# EasyEDA Pro project Rear_ESP32S3_R26.epro, schematic Rear_Mainboard_ESP32S3_V0.3, sheets 1 to 2 of 5

## Sheets
1 01_USB_Power: Assembly Variant: Basic; Board Name: Board1; Create Date: 2026-10-07; Page Name: P1; Project Name: 多模态手写笔_后部主板_V0.1; Schematic Name: Schematic1; Update Date: 2026-10-07; Add into BOM: yes; Company: 嘉立创EDA; Convert to PCB: yes; Page Size: A3; Version: V0.1
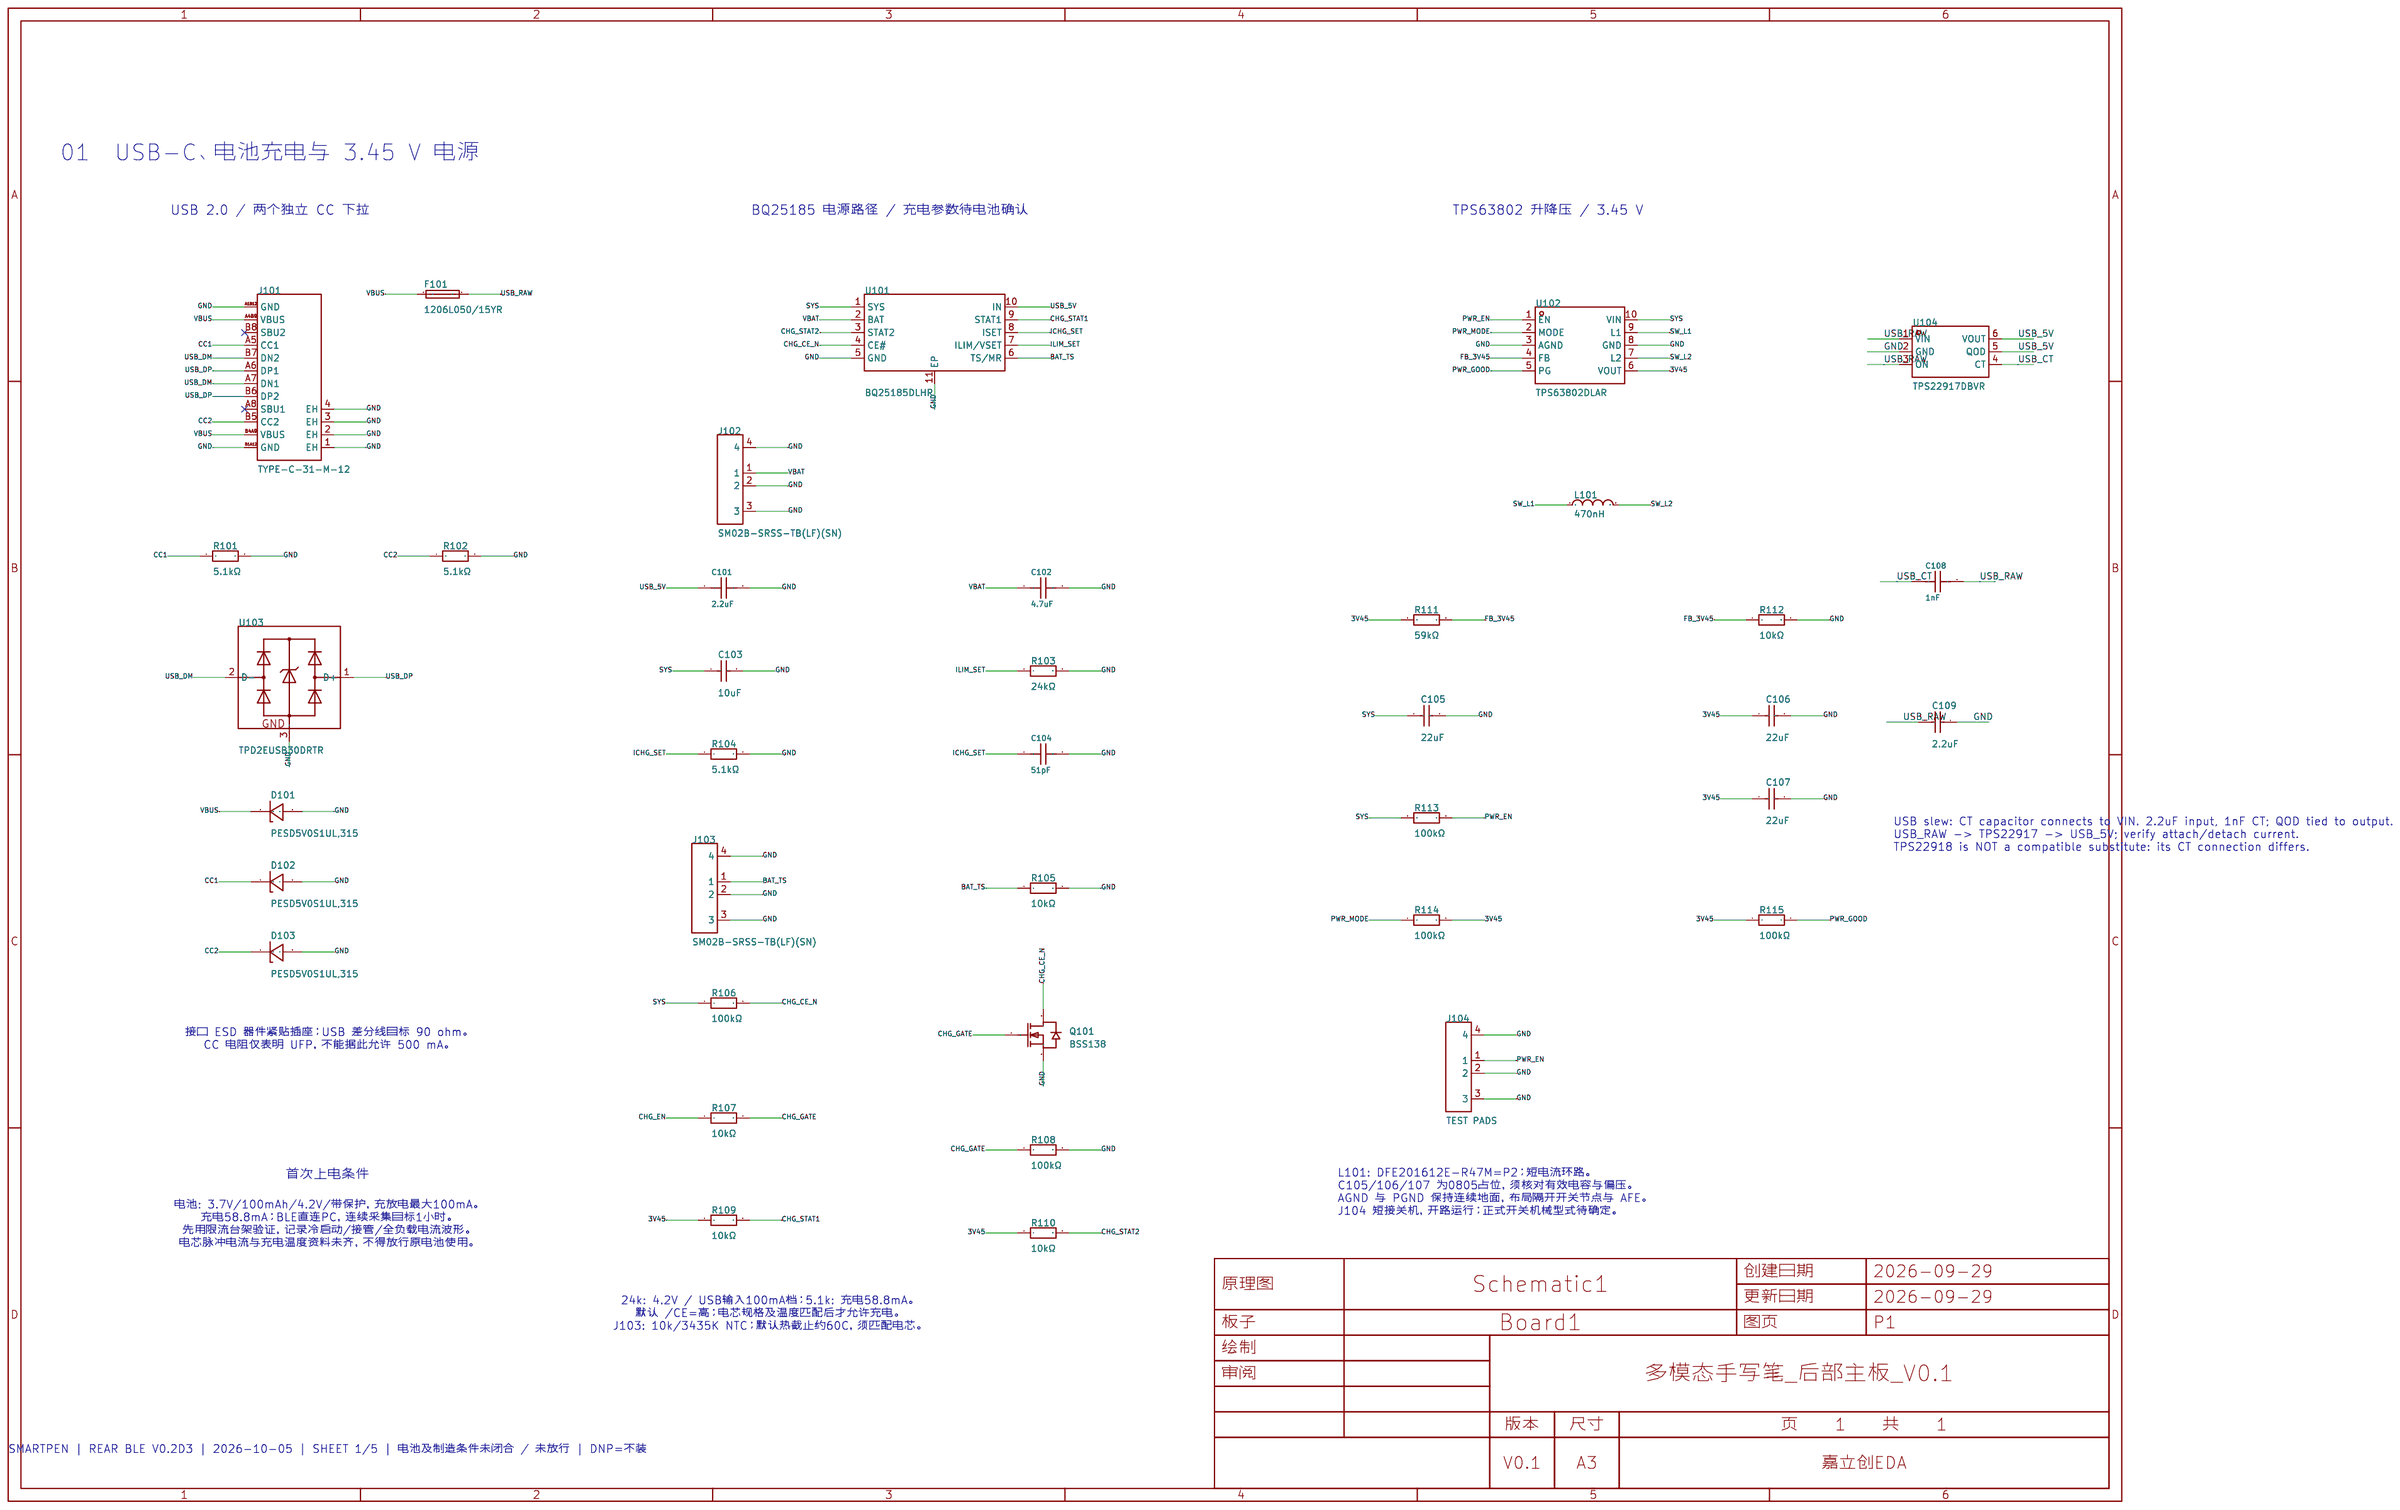
[diagram p0: 01_USB_Power]
2 02_ESP32S3_BLE_USB
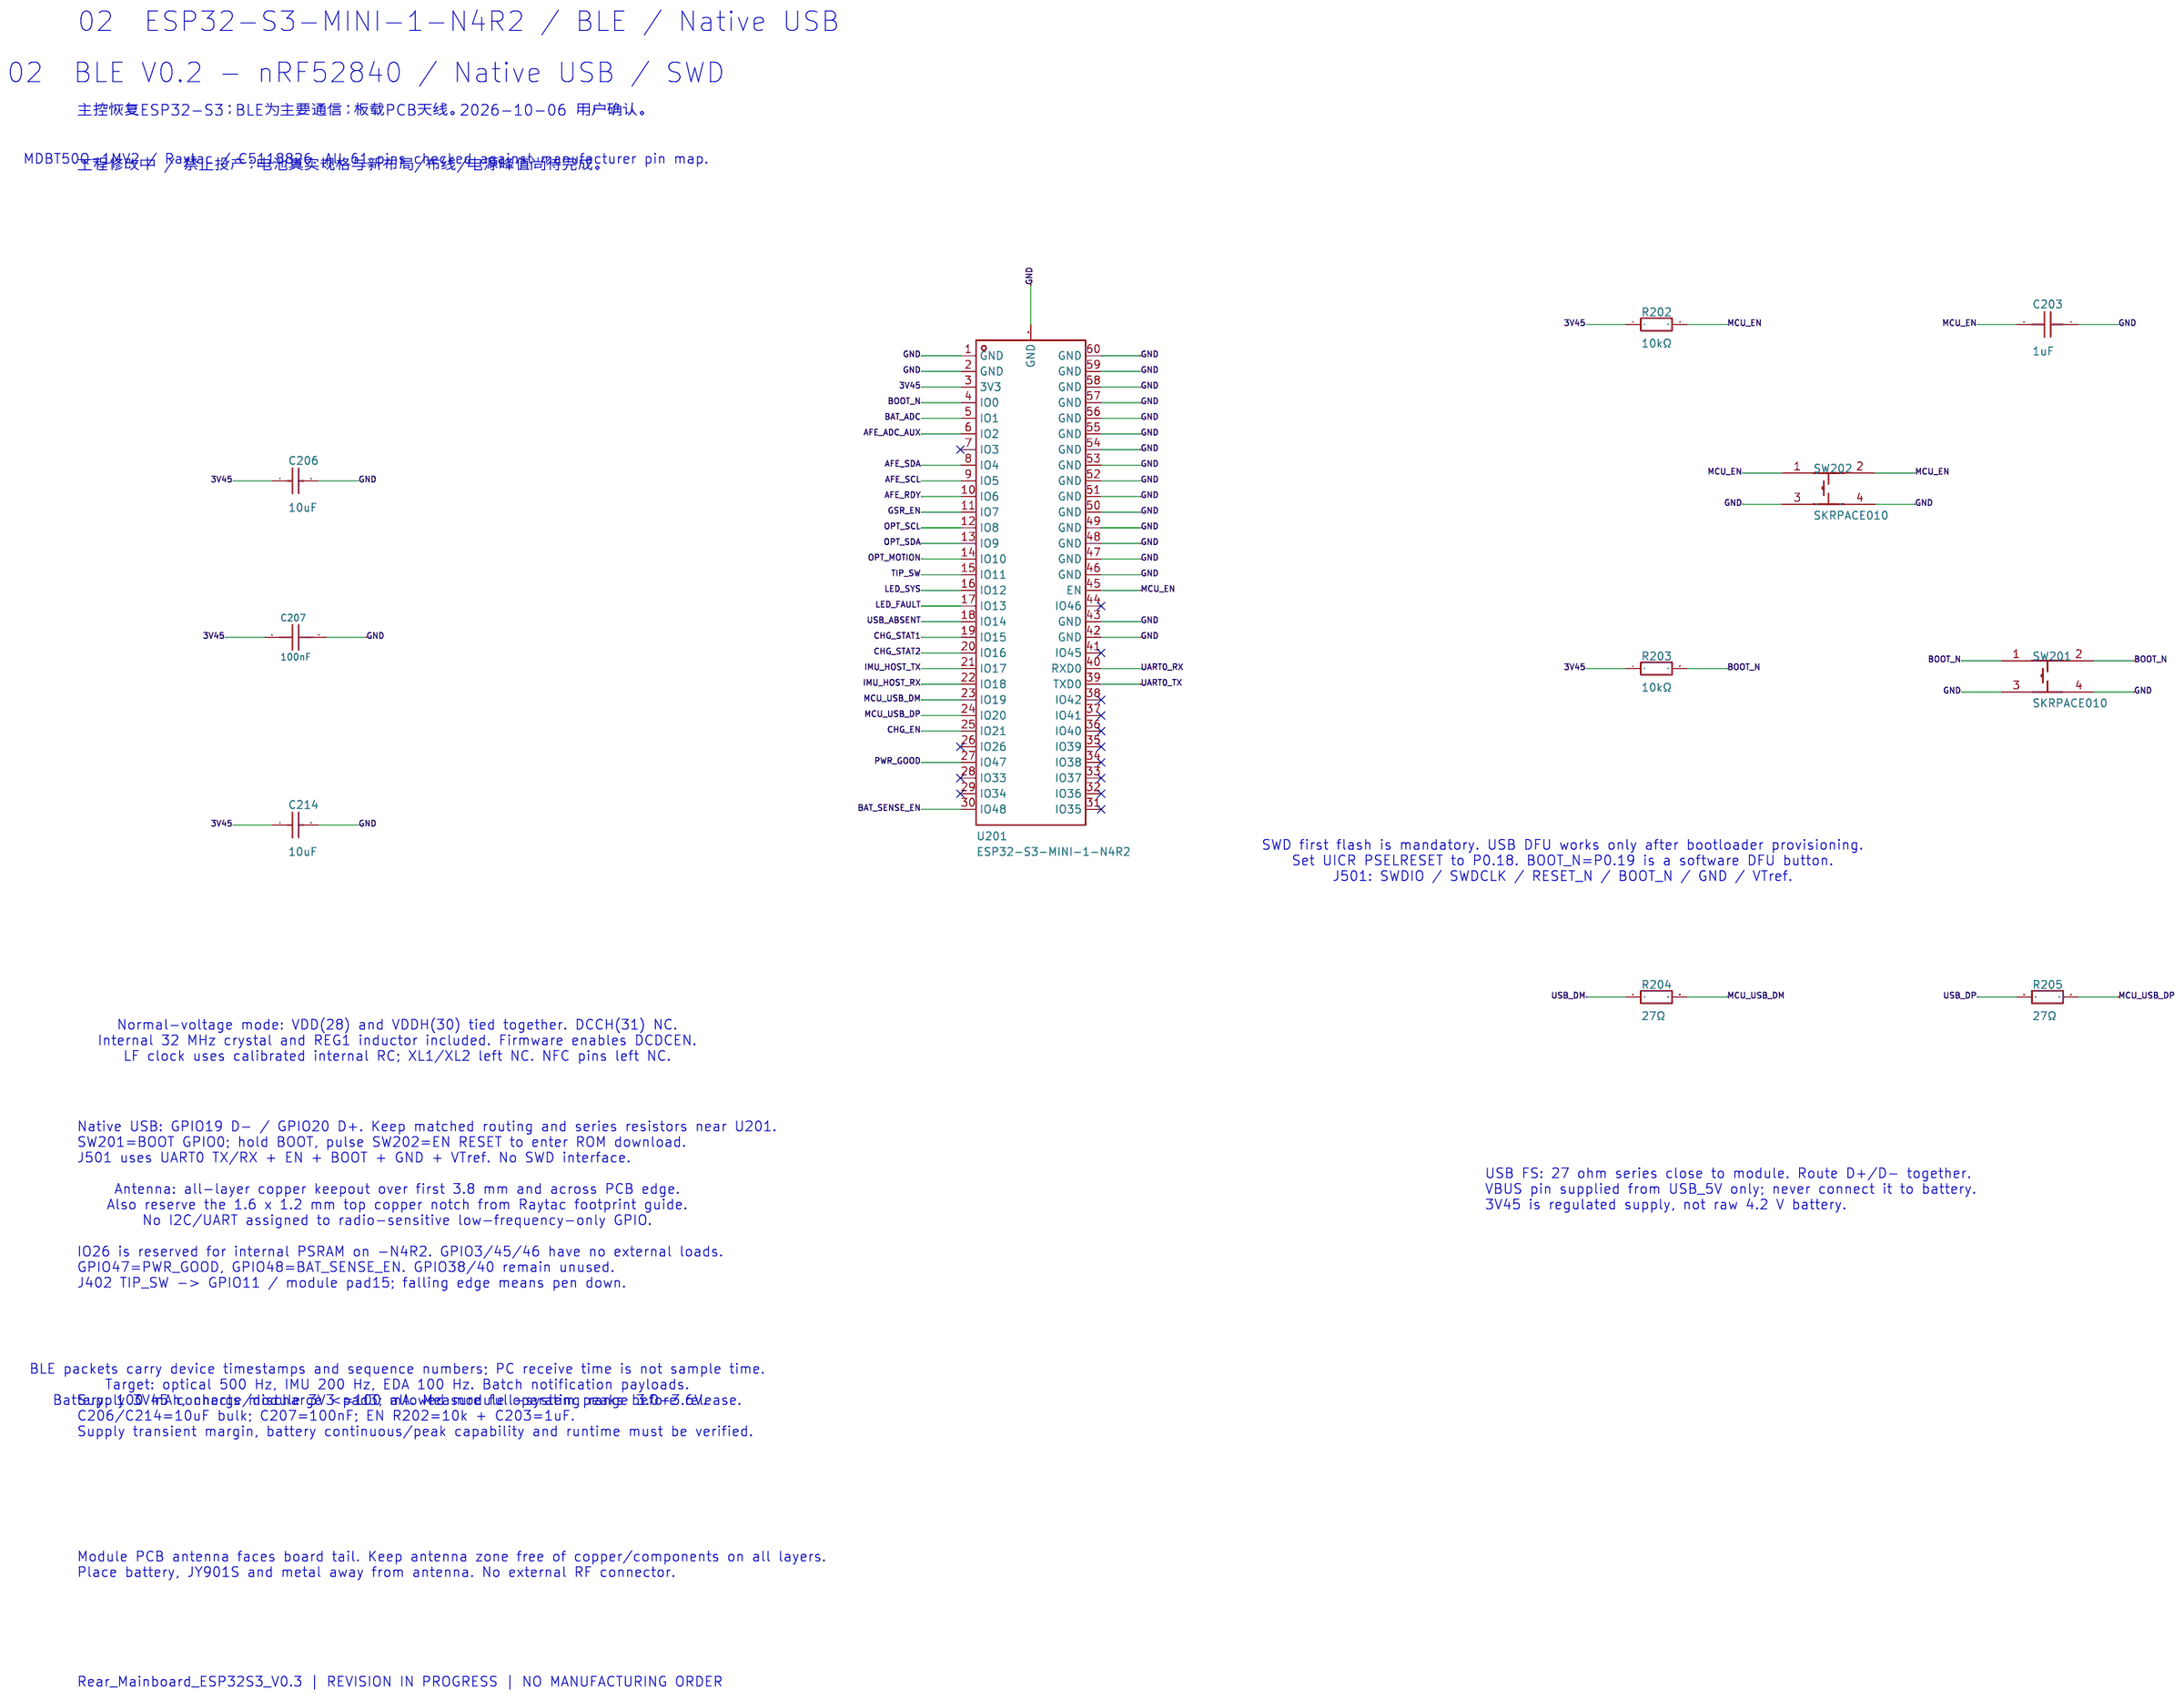
[diagram p1: 02_ESP32S3_BLE_USB]

## Parts
sheet 01_USB_Power
C101  2.2uF  [C0603]
C102  4.7uF  [C0603]
C103  10uF  [C0805]
C104  51pF  [C0603]  (no BOM)
C105  22uF  [C0805]
C106  22uF  [C0805]
C107  22uF  [C0805]
C108  1nF  [C0603]
C109  2.2uF  [C0603]
D101  PESD5V0S1UL,315  [SOD-882_L1.0-W0.6-RD]
D102  PESD5V0S1UL,315  [SOD-882_L1.0-W0.6-RD]
D103  PESD5V0S1UL,315  [SOD-882_L1.0-W0.6-RD]
F101  1206L050/15YR  [F1206]
J101  TYPE-C-31-M-12  [USB-C_SMD-TYPE-C-31-M-12_1]
J102  SM02B-SRSS-TB(LF)(SN)  [CONN-SMD_2P-P1.00_SM02B-SRSS-TB-LF-SN]
J103  SM02B-SRSS-TB(LF)(SN)  [CONN-SMD_2P-P1.00_SM02B-SRSS-TB-LF-SN]
J104  TEST PADS  [SMARTPEN_J104_TEST_4P_P1.27]  (no BOM)
L101  470nH  [IND-SMD_L2.0-W1.6-1]
Q101  BSS138  [SOT-23-3_L3.0-W1.7-P0.95-LS2.9-BR]
R101  5.1kΩ  [R0603]
R102  5.1kΩ  [R0603]
R103  24kΩ  [R0603]
R104  5.1kΩ  [R0603]
R105  10kΩ  [R0603]  (no BOM)
R106  100kΩ  [R0603]
R107  10kΩ  [R0603]
R108  100kΩ  [R0603]
R109  10kΩ  [R0603]
R110  10kΩ  [R0603]
R111  59kΩ  [R0603]
R112  10kΩ  [R0603]
R113  100kΩ  [R0603]
R114  100kΩ  [R0603]
R115  100kΩ  [R0603]
U101  BQ25185DLHR  [WSON-10_L2.2-W2.0-P0.40-BL-EP_TI_DLH0010A]
U102  TPS63802DLAR  [VSON-10_L3.0-W2.0-P0.50-TL]
U103  TPD2EUSB30DRTR  [SOT-9X3-3_L1.0-W0.8-P0.35-LS1.0-BR]
U104  TPS22917DBVR  [SOT-23-6_L2.9-W1.6-P0.95-LS2.8-BR]
sheet 02_ESP32S3_BLE_USB
C203  1uF  [C0603]
C206  10uF  [C0805]
C207  100nF  [C0603]
C214  10uF  [C0805]
R202  10kΩ  [R0603]
R203  10kΩ  [R0603]
R204  27Ω  [R0603]
R205  27Ω  [R0603]
SW201  SKRPACE010  [KEY-SMD_4P-L4.2-W3.2-P2.20-LS4.6]
SW202  SKRPACE010  [KEY-SMD_4P-L4.2-W3.2-P2.20-LS4.6]
U201  ESP32-S3-MINI-1-N4R2  [BULETM-SMD_ESP32-S3-MINI-1-N8]

## Library data of the parts
C101 C109 = CL10A225KO8NNNC: 容值:2.2uF;精度:±10%;额定电压:16V;温度系数:X5R;; LCSC Part Name: 2.2uF ±10% 16V; Supplier Part: C23630; Manufacturer: SAMSUNG(三星); Supplier Footprint: 0603; JLCPCB Part Class: Basic Part; Datasheet: https://item.szlcsc.com/datasheet/CL10A225KO8NNNC/24366.html; Supplier: LCSC; Tolerance: ±10%; Voltage Rating: 16V; Temperature Coefficient: X5R; Review: MPN selected from EDA library; electrical/stock and final assembly validation recorded separately; Assembly: FIT; DesignValue: 2.2uF 16V X5R
C102 = GRM188R71C105KA12D: 容值:4.7uF;精度:±10%;额定电压:10V;材质(温度系数):X5R;; LCSC Part Name: 4.7uF ±10% 10V; Supplier Part: C71633; Manufacturer: muRata(村田); Manufacturer Part: GRM188R61A475KE15D; Supplier Footprint: 0603; JLCPCB Part Class: Extended Part; Datasheet: https://atta.szlcsc.com/upload/public/pdf/source/20161108/1478586449961.pdf; Supplier: LCSC; Tolerance: ±10%; Voltage Rating: 50V; Temperature Coefficient: X5R; Voltage Rated: 10V; Review: MPN selected from EDA library; electrical/stock and final assembly validation recorded separately; PCB Layer: Default; Assembly: FIT; DesignValue: 4.7uF 10V X5R
C103 C206 C214 = GRM21BR61A106KE19L: 容值:10uF;精度:±10%;额定电压:10V;温度系数:X5R;; LCSC Part Name: 10uF ±10% 10V; Supplier Part: C77073; Manufacturer: muRata(村田); Supplier Footprint: 0805; JLCPCB Part Class: Extended Part; Datasheet: https://item.szlcsc.com/datasheet/GRM21BR61A106KE19L/78200.html; Supplier: LCSC; Tolerance: ±10%; Voltage Rating: 10V; Temperature Coefficient: X5R; Review: MPN selected from EDA library; electrical/stock and final assembly validation recorded separately; PCB Layer: Default; Assembly: FIT; DesignValue: 10uF 10V
C104 = GRM1885C1H510JA01D: 容值:51pF;精度:±5%;额定电压:50V;材质(温度系数):C0G;; LCSC Part Name: 51pF ±5% 50V; Supplier Part: C162235; Manufacturer: muRata(村田); Supplier Footprint: 0603; JLCPCB Part Class: Extended Part; Datasheet: https://atta.szlcsc.com/upload/public/pdf/source/20190830/C162235_46C415C4DD40969A99D001D7D0CDBF30.pdf; Supplier: LCSC; Tolerance: ±5%; Voltage Rating: 50V; Temperature Coefficient: C0G; Voltage Rated: 50V; Review: MPN selected from EDA library; electrical/stock and final assembly validation recorded separately; PCB Layer: Default; Assembly: DNP; DesignValue: 51pF DNP
C105 = GRM21BR61A106KE19L: 容值:22uF;精度:±20%;额定电压:10V;材质(温度系数):X5R;; LCSC Part Name: 22uF ±20% 10V; Supplier Part: C441864; Manufacturer: muRata(村田); Manufacturer Part: GRM21BR61A226ME44L; Supplier Footprint: 0805; JLCPCB Part Class: Extended Part; Datasheet: https://atta.szlcsc.com/upload/public/pdf/source/20200305/C490387_23319AE8C154DEB24C505E6C82A8106A.pdf; Supplier: LCSC; Tolerance: ±20%; Voltage Rating: 10V; Temperature Coefficient: X5R; Review: D2: Murata 4.6V typical DC-bias curve with tolerance/temp derating estimates 7.54uF; not guaranteed min or measured startup current; PCB Layer: Default; Assembly: FIT; DesignValue: 22uF 10V X5R / VIN effective margin; Voltage Rated: 10V
C106 C107 = GRM21BR61A226ME44L: 容值:22uF;精度:±20%;额定电压:10V;材质(温度系数):X5R;; LCSC Part Name: 22uF ±20% 10V; Supplier Part: C441864; Manufacturer: muRata(村田); Supplier Footprint: 0805; JLCPCB Part Class: Extended Part; Datasheet: https://atta.szlcsc.com/upload/public/pdf/source/20200305/C490387_23319AE8C154DEB24C505E6C82A8106A.pdf; Supplier: LCSC; Tolerance: ±20%; Voltage Rating: 10V; Temperature Coefficient: X5R; Voltage Rated: 10V; Review: MPN selected from EDA library; electrical/stock and final assembly validation recorded separately; PCB Layer: Default; Assembly: FIT; DesignValue: 22uF 10V
C108 = GRM1885C1H102JA01D: 容值:1nF;精度:±5%;额定电压:50V;材质(温度系数):C0G;; LCSC Part Name: 1nF ±5% 50V; Supplier Part: C77026; Manufacturer: muRata(村田); Supplier Footprint: 0603; JLCPCB Part Class: Extended Part; Datasheet: https://atta.szlcsc.com/upload/public/pdf/source/20200305/C490387_23319AE8C154DEB24C505E6C82A8106A.pdf; Supplier: LCSC; Tolerance: ±5%; Voltage Rating: 50V; Temperature Coefficient: C0G; Voltage Rated: 50V; Review: MPN selected from EDA library; electrical/stock and final assembly validation recorded separately; Assembly: FIT; DesignValue: 1nF 50V C0G
D101-D103 = PESD5V0S1UL,315: 极性:单向;反向截止电压(Vrwm):5V;钳位电压:20V;峰值脉冲电流(Ipp):15A@8/20us;峰值脉冲功率(Ppp):150W;击穿电压(VBR):6.4V;; LCSC Part Name: 单向ESD 5V截止 峰值浪涌电流：15A@8/20us; Supplier Part: C85402; Manufacturer: Nexperia(安世); Supplier Footprint: DFN1006-2; JLCPCB Part Class: Extended Part; Datasheet: https://item.szlcsc.com/datasheet/PESD5V0S1UL%252C315/86575.html; Supplier: LCSC; Polarity: 单向; Reverse Stand-Off Voltage (Vrwm): 5V; Clamping Voltage: 20V; Peak Pulse Current (Ipp): 15A@8/20us; Peak Pulse Power Dissipation (Ppp): 150W; Voltage - Breakdown: 6.4V; Reverse Leakage Current (Ir): 100nA; Number of Channels: 单路; level of protection: IEC 61000-4-5；IEC 61000-4-2; Type: ESD; Junction Capacitance: 152pF; PCB Layer: Default; Assembly: FIT; Review: Engineering draft; MPN and footprint require review
F101 = 1206L050/15YR: 耐压(Vmax):15V;最大电流(Imax):100A;保持电流(Ihold):500mA;跳闸电流(Itrip):1A;; LCSC Part Name: 15V 500mA 1206自恢复; Supplier Part: C151162; Manufacturer: Littelfuse(美国力特); Supplier Footprint: 1206; JLCPCB Part Class: Extended Part; Datasheet: https://item.szlcsc.com/datasheet/1206L050%252F15YR/162502.html; Supplier: LCSC; Voltage - Max: 15V; Current - Max: 100A; Hold Current: 500mA; Trip Current: 1A; Power Dissipation: 600mW; Resistance - Initial (Ri) (Min): 150mΩ; Resistance - Post Trip (R1) (Max): 750mΩ; Time to Trip(Max): 100ms; Operating Temperature: -40℃~+85℃; Length: 3.4mm; Width: 1.8mm; Height: 0.75mm; PCB Layer: Default; Assembly: FIT; Review: Engineering draft; MPN and footprint require review
J101 = TYPE-C-31-M-12: 连接器类型:Type-C;协议标准:-;公母:母;安装方式:卧贴;触点数量:16P;端口数量:1;额定电流 - 电源:5A;工作温度:-30℃~+80℃;; LCSC Part Name: Type-C 母 卧贴; Supplier Part: C165948; Manufacturer: 韩国韩荣; Supplier Footprint: SMD; JLCPCB Part Class: Extended Part; Datasheet: https://item.szlcsc.com/datasheet/TYPE-C-31-M-12/177331.html; Supplier: LCSC; Connector Type: Type-C; Gender: 母; Mounting Type: 卧贴; Number of Contacts: 16P; Number of Ports: 1; Current Rating-Power: 5A; Voltage Rating: 20V; Connect-Disconnect Life: 1万次; Length: 7.35mm; Operating Temperature: -30℃~+80℃; PCB Layer: Default; Assembly: FIT; Review: Engineering draft; MPN and footprint require review
J102 = SM02B-SRSS-TB(LF)(SN): 插针结构:1x2P;间距:1mm;安装方式:卧贴;参考系列:SH;总PIN数:2P;排数:1;每排PIN数:2;行距:-;额定电流:1A;触头材质:铜合金;触头镀层:锡;工作温度:-25℃~+85℃;; LCSC Part Name: 1x2P 间距:1mm 卧贴 系列:SH; Supplier Part: C160402; Manufacturer: JST; Supplier Footprint: SMD,P=1mm,卧贴; JLCPCB Part Class: Extended Part; Datasheet: https://item.szlcsc.com/datasheet/SM02B-SRSS-TB(LF)(SN)/171782.html; Supplier: LCSC; Pins Structure: 1x2P; Pitch: 1mm; Mounting Type: 卧贴; Reference Series: SH; Number of Pins: 2P; Number of Rows: 1; Number of PINs Per Row: 2; Current Rating: 1A; Contact Material: 铜合金; Contact Plating: 锡; Operating Temperature: -25℃~+85℃; Voltage Rating: 50V; Plastic Material: PA; Flame Retardant Rating: UL94V-0; Supplementary Features: 辅助焊脚; Color: 白色; Z-Height of the Board: 2.9mm; X-Length of Bottom Edge on Board (Spacing Line): 4mm; Y-Width of Bottom Edge on Board: 4.32mm; PCB Layer: Default; Assembly: FIT; Review: Engineering draft; MPN and footprint require review
J103 = SM02B-SRSS-TB(LF)(SN): 插针结构:1x2P;间距:1mm;安装方式:卧贴;参考系列:SH;总PIN数:2P;排数:1;每排PIN数:2;行距:-;额定电流:1A;触头材质:铜合金;触头镀层:锡;工作温度:-25℃~+85℃;; LCSC Part Name: 1x2P 间距:1mm 卧贴 系列:SH; Supplier Part: C160402; Manufacturer: JST; Supplier Footprint: SMD,P=1mm,卧贴; JLCPCB Part Class: Extended Part; Datasheet: https://item.szlcsc.com/datasheet/SM02B-SRSS-TB(LF)(SN)/171782.html; Supplier: LCSC; Pins Structure: 1x2P; Pitch: 1mm; Mounting Type: 卧贴; Reference Series: SH; Number of Pins: 2P; Number of Rows: 1; Number of PINs Per Row: 2; Current Rating: 1A; Contact Material: 铜合金; Contact Plating: 锡; Operating Temperature: -25℃~+85℃; Voltage Rating: 50V; Plastic Material: PA; Flame Retardant Rating: UL94V-0; Supplementary Features: 辅助焊脚; Color: 白色; Z-Height of the Board: 2.9mm; X-Length of Bottom Edge on Board (Spacing Line): 4mm; Y-Width of Bottom Edge on Board: 4.32mm; PCB Layer: Default; Assembly: FIT; Review: External 10k beta3435 NTC fixed to battery; not a battery power connector
J104 = SMARTPEN_J104_TEST_4P_P1.27: PCB exposed copper test pads; no purchased component; LCSC Part Name: 1x2P 间距:1mm 卧贴 系列:SH; Manufacturer: PCB copper; Supplier Footprint: SMD,P=1mm,卧贴; JLCPCB Part Class: Extended Part; Datasheet: https://item.szlcsc.com/datasheet/SM02B-SRSS-TB(LF)(SN)/171782.html; Supplier: Not purchased; Pins Structure: 1x2P; Pitch: 1mm; Mounting Type: 卧贴; Reference Series: SH; Number of Pins: 2P; Number of Rows: 1; Number of PINs Per Row: 2; Current Rating: 1A; Contact Material: 铜合金; Contact Plating: 锡; Operating Temperature: -25℃~+85℃; Voltage Rating: 50V; Plastic Material: PA; Flame Retardant Rating: UL94V-0; Supplementary Features: 辅助焊脚; Color: 白色; Z-Height of the Board: 2.9mm; X-Length of Bottom Edge on Board (Spacing Line): 4mm; Y-Width of Bottom Edge on Board: 4.32mm; Assembly: PCB_ONLY; PCB Layer: Default; Review: Bare test pads: pin 1 EN, pin 2/3/4 GND. Short 1-2 to disable 3V45; not a purchased connector.
L101 = DFE201612E-R47M=P2: 电感值:470nH;精度:±20%;额定电流:4.5A;饱和电流(Isat):5.5A;; LCSC Part Name: 470nH ±20% 5.5A; Supplier Part: C668312; Manufacturer: muRata(村田); Supplier Footprint: 0806; JLCPCB Part Class: Extended Part; Datasheet: https://atta.szlcsc.com/upload/public/pdf/source/20220704/803E7827D5B93CBE7ABCC328F9E8474C.pdf; Supplier: LCSC; Tolerance: ±20%; Current Rating: 4.5A; Current - Saturation(Isat): 5.5A; DC Resistance(DCR): 26mΩ; PCB Layer: Default; Assembly: FIT; Review: Engineering draft; MPN and footprint require review; DesignValue: 0.47uH
Q101 = BSS138: 数量:1个N沟道;漏源电压(Vdss):50V;连续漏极电流(Id):220mA;导通电阻(RDS(on)):4Ω@4.5V;耗散功率(Pd):350mW;阈值电压(Vgs(th)):1.6V;; LCSC Part Name: 1个N沟道 耐压:50V 电流:0.22A; Supplier Part: C193019; Manufacturer: AnBon(安邦); Supplier Footprint: SOT-23; JLCPCB Part Class: Extended Part; Datasheet: https://item.szlcsc.com/datasheet/BSS138/226058.html; Supplier: LCSC; Number: 1个N沟道; Drain to Source Voltage: 50V; Current - Continuous Drain(Id): 220mA; RDS(on): 4Ω@4.5V; Pd - Power Dissipation: 350mW; Gate Threshold Voltage (Vgs(th)): 1.6V; Input Capacitance(Ciss): 27pF; Reverse Transfer Capacitance (Crss@Vds): 6pF; Type: N沟道; Output Capacitance(Coss): 13pF; Vgs: ±20V; PCB Layer: Default; Assembly: FIT; Review: Engineering draft; MPN and footprint require review
R101 R102 = RC0603FR-075K1L: 电阻类型:厚膜电阻;阻值:5.1kΩ;精度:±1%;功率:100mW;工作电压:75V;温度系数:±100ppm/℃;; LCSC Part Name: 厚膜电阻 5.1kΩ ±1% 100mW; Supplier Part: C105580; Manufacturer: YAGEO(国巨); Supplier Footprint: 0603; JLCPCB Part Class: Extended Part; Datasheet: https://item.szlcsc.com/datasheet/RC0603FR-075K1L/106795.html; Supplier: LCSC; Type: 厚膜电阻; Tolerance: ±1%; Power(Watts): 100mW; Voltage-Supply(Max): 75V; Temperature Coefficient: ±100ppm/℃; Operating Temperature: -55℃~+155℃; Review: MPN selected from EDA library; electrical/stock and final assembly validation recorded separately; PCB Layer: Default; Assembly: FIT; DesignValue: 5.1k 1%
R103 = RC0603FR-0724KL: 电阻类型:厚膜电阻;阻值:24kΩ;精度:±1%;功率:100mW;最大工作电压:75V;温度系数:±100ppm/℃;; LCSC Part Name: 厚膜电阻 24kΩ ±1% 100mW; Supplier Part: C137760; Manufacturer: YAGEO(国巨); Supplier Footprint: 0603; JLCPCB Part Class: Extended Part; Datasheet: https://atta.szlcsc.com/upload/public/pdf/source/20180821/C275644_0D56F95EFF785E7D9A1FEF436B37DA78.pdf; Supplier: LCSC; Type: 厚膜电阻; Tolerance: ±1%; Power(Watts): 100mW; Voltage-Supply(Max): 50V; Temperature Coefficient: ±100ppm/℃; Operating Temperature: -55℃~+155℃; Overload Voltage (Max): 75V; Operating Temperature Range: -55℃~+155℃; Review: MPN selected from EDA library; electrical/stock and final assembly validation recorded separately; PCB Layer: Default; Assembly: FIT; DesignValue: 24k 1%
R104 = RC0603FR-076K04L: 电阻类型:厚膜电阻;阻值:5.1kΩ;精度:±1%;功率:100mW;工作电压:75V;温度系数:±100ppm/℃;; LCSC Part Name: 厚膜电阻 5.1kΩ ±1% 100mW; Supplier Part: C105580; Manufacturer: YAGEO(国巨); Manufacturer Part: RC0603FR-075K1L; Supplier Footprint: 0603; JLCPCB Part Class: Extended Part; Datasheet: https://item.szlcsc.com/datasheet/RC0603FR-075K1L/106795.html; Supplier: LCSC; Type: 厚膜电阻; Tolerance: ±1%; Power(Watts): 100mW; Voltage-Supply(Max): 75V; Temperature Coefficient: ±100ppm/℃; Operating Temperature: -55℃~+155℃; Review: D2: ICHG nominal 58.82mA; worst upper 65.36mA with +/-10% IC and +/-1% resistor; PCB Layer: Default; Assembly: FIT; DesignValue: 5.1k 1% / ICHG 58.8mA
R105 = RC0603FR-0710KL: 电阻类型:厚膜电阻;阻值:10kΩ;精度:±1%;功率:100mW;工作电压:75V;温度系数:±100ppm/℃;; LCSC Part Name: 厚膜电阻 10kΩ ±1% 100mW; Supplier Part: C98220; Manufacturer: YAGEO(国巨); Supplier Footprint: 0603; JLCPCB Part Class: Extended Part; Datasheet: https://item.szlcsc.com/datasheet/RC0603FR-0710KL/99429.html; Supplier: LCSC; Type: 厚膜电阻; Tolerance: ±1%; Power(Watts): 100mW; Voltage-Supply(Max): 75V; Temperature Coefficient: ±100ppm/℃; Operating Temperature: -55℃~+155℃; Review: MPN selected from EDA library; electrical/stock and final assembly validation recorded separately; PCB Layer: Default; Assembly: DNP; DesignValue: 10k DNP
R106 R108 R113-R115 = RC0603FR-07100KL: 电阻类型:厚膜电阻;阻值:100kΩ;精度:±1%;功率:100mW;工作电压:75V;温度系数:±100ppm/℃;; LCSC Part Name: 厚膜电阻 100kΩ ±1%; Supplier Part: C14675; Manufacturer: YAGEO(国巨); Supplier Footprint: 0603; JLCPCB Part Class: Extended Part; Datasheet: https://item.szlcsc.com/datasheet/RC0603FR-07100KL/15343.html; Supplier: LCSC; Type: 厚膜电阻; Tolerance: ±1%; Power(Watts): 100mW; Voltage-Supply(Max): 75V; Temperature Coefficient: ±100ppm/℃; Operating Temperature: -55℃~+155℃; Review: MPN selected from EDA library; electrical/stock and final assembly validation recorded separately; PCB Layer: Default; Assembly: FIT; DesignValue: 100k
R107 R109 R110 = RC0603FR-0710KL: 电阻类型:厚膜电阻;阻值:10kΩ;精度:±1%;功率:100mW;工作电压:75V;温度系数:±100ppm/℃;; LCSC Part Name: 厚膜电阻 10kΩ ±1% 100mW; Supplier Part: C98220; Manufacturer: YAGEO(国巨); Supplier Footprint: 0603; JLCPCB Part Class: Extended Part; Datasheet: https://item.szlcsc.com/datasheet/RC0603FR-0710KL/99429.html; Supplier: LCSC; Type: 厚膜电阻; Tolerance: ±1%; Power(Watts): 100mW; Voltage-Supply(Max): 75V; Temperature Coefficient: ±100ppm/℃; Operating Temperature: -55℃~+155℃; Review: MPN selected from EDA library; electrical/stock and final assembly validation recorded separately; PCB Layer: Default; Assembly: FIT; DesignValue: 10k
R111 = RT0603BRD0759KL: 电阻类型:薄膜电阻;阻值:59kΩ;精度:±0.1%;功率:100mW;温度系数:±25ppm/℃;; LCSC Part Name: 薄膜电阻 59kΩ ±0.1% 100mW; Supplier Part: C705787; Manufacturer: YAGEO(国巨); Supplier Footprint: 0603; JLCPCB Part Class: Extended Part; Datasheet: https://atta.szlcsc.com/upload/public/pdf/source/20200720/C705787_DFA049E88C13193794B01292C1F100D8.pdf; Supplier: LCSC; Type: 薄膜电阻; Tolerance: ±0.1%; Power(Watts): 100mW; Voltage-Supply(Max): 50V; Temperature Coefficient: ±25ppm/℃; Operating Temperature: -55℃~+155℃; Operating Temperature Range: -55℃~+155℃; Review: MPN selected from EDA library; electrical/stock and final assembly validation recorded separately; PCB Layer: Default; Assembly: FIT; DesignValue: 59k 0.1%
R112 = RT0603BRD0710KL: 电阻类型:薄膜电阻;阻值:10kΩ;精度:±0.1%;功率:100mW;工作电压:75V;温度系数:±25ppm/℃;; LCSC Part Name: 薄膜电阻 10kΩ ±0.1% 100mW; Supplier Part: C95204; Manufacturer: YAGEO(国巨); Supplier Footprint: 0603; JLCPCB Part Class: Extended Part; Datasheet: https://item.szlcsc.com/datasheet/RT0603BRD0710KL/96405.html; Supplier: LCSC; Type: 薄膜电阻; Tolerance: ±0.1%; Power(Watts): 100mW; Voltage-Supply(Max): 75V; Temperature Coefficient: ±25ppm/℃; Operating Temperature: -55℃~+155℃; Review: MPN selected from EDA library; electrical/stock and final assembly validation recorded separately; PCB Layer: Default; Assembly: FIT; DesignValue: 10k 0.1%
U101 = BQ25185DLHR: 工作电压:3V~18V;最大充电电流:1A;电池类型:锂电池；磷酸铁锂电池;电池节数:1;; LCSC Part Name: 单节1A独立线性电池充电器，具备电源路径、工厂模式和电池跟踪功能; Supplier Part: C19725033; Manufacturer: TI(德州仪器); Supplier Footprint: WSON-10-EP(2.2x2); JLCPCB Part Class: Extended Part; Datasheet: https://www.ti.com.cn/cn/lit/ds/symlink/bq25185.pdf?ts=1739415017761&ref_url=https%253A%252F%252Fwww.ti.com.cn%252Fproduct%252Fcn%252FBQ25185%253FkeyMatch%253Dbq25185%2526tisearch%253Duniversal_search; Supplier: LCSC; The Chip Type: 充电芯片; Voltage - Supply: 3V~18V; Charge Current - Max: 1A; Charging Saturation Voltage: 4.4V; End-Off Voltage: 2.2V; Type of Battery: 锂电池；磷酸铁锂电池; Number of Cells: 1; Operating Temperature: -40℃~+125℃; Battery Temperature Detection: 支持; Supply Current (Iq): 4uA; PCB Layer: Default; Assembly: FIT; Review: Engineering draft; MPN and footprint require review
U102 = TPS63802DLAR_C2845237: 功能类型:升降压型;工作电压:1.3V~5.5V;输出电压:1.8V~5.2V;输出电流:2A;输出类型:可调;; LCSC Part Name: 升降压型 2A 1.3V~5.5V; Supplier Part: C2845237; Manufacturer: TI(德州仪器); Supplier Footprint: VSON-10(2x3); JLCPCB Part Class: Extended Part; Datasheet: https://www.ti.com/cn/lit/ds/symlink/tps63802.pdf; Supplier: LCSC; Function: 升降压型; Voltage - Supply: 1.3V~5.5V; Output Voltage: 1.8V~5.2V; Output Current: 2A; Frequency - Switching: 2.1MHz；1.4MHz；1.6MHz; Operating Temperature: -40℃~+125℃@(TJ); Synchronous Rectifier: 是; Number of Outputs: 1; Topology: 降压-升压式; Quiescent Current: 11uA; Switch tube (built-in/external): 内置; Output Type: 可调; Features: 轻载高效模式；过流保护；工作状态指示；负载断开; PCB Layer: Default; Assembly: FIT; Review: Engineering draft; MPN and footprint require review
U103 = TPD2EUSB30DRTR: 极性:单向;反向截止电压(Vrwm):5.5V;钳位电压:8V;峰值脉冲电流(Ipp):5A@8/20us;峰值脉冲功率(Ppp):45W;击穿电压(VBR):7V;; LCSC Part Name: 单向ESD 5.5V截止 峰值脉冲电流：5A@8/20us; Supplier Part: C97502; Manufacturer: TI(德州仪器); Supplier Footprint: SOT(9x3); JLCPCB Part Class: Extended Part; Datasheet: https://www.ti.com/cn/lit/ds/symlink/tpd2eusb30.pdf; Supplier: LCSC; Polarity: 单向; Reverse Stand-Off Voltage (Vrwm): 5.5V; Clamping Voltage: 8V; Peak Pulse Current (Ipp): 5A@8/20us; Peak Pulse Power Dissipation (Ppp): 45W; Voltage - Breakdown: 7V; Number of Channels: 双路; Operating Temperature: -40℃~+85℃; level of protection: IEC 61000-4-5；IEC 61000-4-2; Type: ESD; Junction Capacitance: 0.7pF; PCB Layer: Default; Assembly: FIT; Review: Engineering draft; MPN and footprint require review
U104 = TPS22917DBVR: 类型:负载开关;通道数:1;输入控制逻辑:高电平有效;工作电压:0V~5.5V;最大连续电流:2A;导通电阻:80mΩ;; LCSC Part Name: 1V至5.5V、2A、超低泄漏负载开关; Supplier Part: C2681320; Manufacturer: TI(德州仪器); Supplier Footprint: SOT-23-6; JLCPCB Part Class: Extended Part; Datasheet: https://www.ti.com/cn/lit/ds/symlink/tps22917.pdf; Supplier: LCSC; Type: 负载开关; Number of Channels: 1; Control Input Logic: 高电平有效; Voltage - Supply: 0V~5.5V; Maximum Continuous Current: 2A; RDS(on): 80mΩ; Features: 软启动；反向电流阻断；输出放电功能; Operating Temperature	-: -40℃~+125℃; Assembly: FIT
C203 = CL10A105KB8NNNC: 容值:1uF;精度:±10%;额定电压:50V;温度系数:X5R;; LCSC Part Name: 1uF ±10% 50V; Supplier Part: C15849; Manufacturer: SAMSUNG(三星); Supplier Footprint: 0603; JLCPCB Part Class: Basic Part; Datasheet: https://item.szlcsc.com/datasheet/CL10A105KB8NNNC/16531.html; Supplier: LCSC; Tolerance: ±10%; Voltage Rating: 50V; Temperature Coefficient: X5R; PCB Layer: Default; Assembly: FIT
C207 = GRM188R71C104KA01D: 容值:100nF;精度:±10%;额定电压:16V;材质(温度系数):X7R;; LCSC Part Name: 100nF ±10% 16V; Supplier Part: C45000; Manufacturer: muRata(村田); Supplier Footprint: 0603; JLCPCB Part Class: Extended Part; Datasheet: https://atta.szlcsc.com/upload/public/pdf/source/20161108/1478586365848.pdf; Supplier: LCSC; Tolerance: ±10%; Voltage Rating: 50V; Temperature Coefficient: X7R; Voltage Rated: 16V; Review: MPN selected from EDA library; electrical/stock and final assembly validation recorded separately; PCB Layer: Default; Assembly: FIT; DesignValue: 100nF 10V
R202 R203 = RC0603FR-0710KL: 电阻类型:厚膜电阻;阻值:10kΩ;精度:±1%;功率:100mW;工作电压:75V;温度系数:±100ppm/℃;; LCSC Part Name: 厚膜电阻 10kΩ ±1% 100mW; Supplier Part: C98220; Manufacturer: YAGEO(国巨); Supplier Footprint: 0603; JLCPCB Part Class: Extended Part; Datasheet: https://item.szlcsc.com/datasheet/RC0603FR-0710KL/99429.html; Supplier: LCSC; Type: 厚膜电阻; Tolerance: ±1%; Power(Watts): 100mW; Voltage-Supply(Max): 75V; Temperature Coefficient: ±100ppm/℃; Operating Temperature: -55℃~+155℃; Review: MPN selected from EDA library; electrical/stock and final assembly validation recorded separately; PCB Layer: Default; Assembly: FIT; DesignValue: 10k 1%
R204 R205 = RC0603FR-0727RL: 电阻类型:厚膜电阻;阻值:27Ω;精度:±1%;功率:100mW;最大工作电压:75V;温度系数:±100ppm/℃;; LCSC Part Name: 厚膜电阻 27Ω ±1% 100mW; Supplier Part: C137753; Manufacturer: YAGEO(国巨); Supplier Footprint: 0603; JLCPCB Part Class: Extended Part; Datasheet: https://atta.szlcsc.com/upload/public/pdf/source/20180821/C275644_0D56F95EFF785E7D9A1FEF436B37DA78.pdf; Supplier: LCSC; Type: 厚膜电阻; Tolerance: ±1%; Power(Watts): 100mW; Voltage-Supply(Max): 50V; Temperature Coefficient: ±100ppm/℃; Operating Temperature: -55℃~+155℃; Overload Voltage (Max): 75V; Operating Temperature Range: -55℃~+155℃; Review: MPN selected from EDA library; electrical/stock and final assembly validation recorded separately; PCB Layer: Default; Assembly: FIT; DesignValue: 27R 1%
SW201 = SKRPACE010: 电路结构:单刀单掷;按钮形状:椭圆形按钮;安装方式:立贴;开关长度:4.2mm;开关宽度:3.2mm;开关高度:2.5mm;触点电流:50mA;额定电压:16V;带灯:-;工作寿命:-;; LCSC Part Name: 4.2*3.2*2.5mm 立贴 轻触开关; Supplier Part: C139797; Manufacturer: ALPSALPINE(阿尔卑斯阿尔派); Supplier Footprint: SMD-4P,4.2x3.2mm; JLCPCB Part Class: Extended Part; Datasheet: https://item.szlcsc.com/datasheet/SKRPACE010/151122.html; Supplier: LCSC; Circuit: 单刀单掷; Actuator Style: 椭圆形按钮; Mounting Type: 立贴; Length: 4.2mm; Width: 3.2mm; Switch Height: 2.5mm; Contact Current: 50mA; Voltage Rating: 16V; PCB Layer: Default; Assembly: FIT; Review: BLE V0.2; check final BOM; DesignValue: BOOT
SW202 = SKRPACE010: 电路结构:单刀单掷;按钮形状:椭圆形按钮;安装方式:立贴;开关长度:4.2mm;开关宽度:3.2mm;开关高度:2.5mm;触点电流:50mA;额定电压:16V;带灯:-;工作寿命:-;; LCSC Part Name: 4.2*3.2*2.5mm 立贴 轻触开关; Supplier Part: C139797; Manufacturer: ALPSALPINE(阿尔卑斯阿尔派); Supplier Footprint: SMD-4P,4.2x3.2mm; JLCPCB Part Class: Extended Part; Datasheet: https://item.szlcsc.com/datasheet/SKRPACE010/151122.html; Supplier: LCSC; Circuit: 单刀单掷; Actuator Style: 椭圆形按钮; Mounting Type: 立贴; Length: 4.2mm; Width: 3.2mm; Switch Height: 2.5mm; Contact Current: 50mA; Voltage Rating: 16V; PCB Layer: Default; Assembly: FIT; Review: BLE V0.2; check final BOM; DesignValue: RESET
U201 = ESP32-S3-MINI-1-N4R2: 核心芯片:ESP32-S3;频率:2.4GHz;天线形式:板载PCB天线;发射功率:20.5dBm;接收灵敏度:-103.5dBm;; LCSC Part Name: 不带固件 小尺寸模组，集成2.4GHz Wi-Fi(802.11b/g/n)+Bluetooth 5(LE); Supplier Part: C3013941; Manufacturer: ESPRESSIF(乐鑫); Supplier Footprint: SMD; JLCPCB Part Class: Extended Part; Datasheet: https://item.szlcsc.com/datasheet/ESP32-S3-MINI-1-N4R2/3522411.html; Supplier: LCSC; Utilized IC / Part: ESP32-S3; Wireless Standard: Bluetooth5.0; Interface Type: I2C；GPIO；UART；SPI；USB；I2S; Antenna Type: 板载PCB天线; Output Power: 20.5dBm; Voltage - Supply: 3V~3.6V; Receive  Current: 95mA; Send  Current: 355mA; Sensitivity: -103.5dBm; Operating Temperature: -40℃~+85℃; PCB Layer: Default; Assembly: FIT; Review: ESP32 restored 2026-10-06; BLE primary; PCB antenna

## Nets
3V45: C106.1 C107.1 C206.1 C207.1 C214.1 R109.1 R110.1 R111.1 R114.2 R115.1 R202.1 R203.1 U102.6(VOUT) U201.3(3V3) ; also on sheet 3 4 5
GND: C101.2 C102.2 C103.2 C104.2 C105.2 C106.2 C107.2 C109.2 C203.2 C206.2 C207.2 C214.2 D101.2(A) D102.2(A) D103.2(A) J101.1(EH) J101.2(EH) J101.3(EH) J101.4(EH) J101.A1B12(GND) J101.B1A12(GND) J102.2 J102.3 J102.4 J103.2 J103.3 J103.4 J104.2 J104.3 J104.4 Q101.2(S) R101.2 R102.2 R103.2 R104.2 R105.2 R108.2 R112.2 SW201.3 SW201.4 SW202.3 SW202.4 U101.5(GND) U101.11(EP) U102.3(AGND) U102.8(GND) U103.3(GND) U104.2(GND) U201.1(GND) U201.2(GND) U201.42(GND) U201.43(GND) U201.46(GND) U201.47(GND) U201.48(GND) U201.49(GND) U201.50(GND) U201.51(GND) U201.52(GND) U201.53(GND) U201.54(GND) U201.55(GND) U201.56(GND) U201.57(GND) U201.58(GND) U201.59(GND) U201.60(GND) U201.GND ; also on sheet 3 4 5
VBAT: C102.1 J102.1 U101.2(BAT) ; also on sheet 5
VBUS: D101.1(C) F101.1 J101.A4B9(VBUS) J101.B4A9(VBUS) ; also on sheet 3
AFE_ADC_AUX: U201.6(IO2) ; also on sheet 3
AFE_RDY: U201.10(IO6) ; also on sheet 3
AFE_SCL: U201.9(IO5) ; also on sheet 3
AFE_SDA: U201.8(IO4) ; also on sheet 3
BAT_ADC: U201.5(IO1) ; also on sheet 5
BAT_SENSE_EN: U201.30(IO48) ; also on sheet 5
BAT_TS: J103.1 R105.1 U101.6(TS/MR)
BOOT_N: R203.2 SW201.1 SW201.2 U201.4(IO0) ; also on sheet 5
CC1: D102.1(C) J101.A5(CC1) R101.1
CC2: D103.1(C) J101.B5(CC2) R102.1
CHG_CE_N: Q101.3(D) R106.2 U101.4(CE#)
CHG_EN: R107.1 U201.25(IO21)
CHG_GATE: Q101.1(G) R107.2 R108.1
CHG_STAT1: R109.2 U101.9(STAT1) U201.19(IO15)
CHG_STAT2: R110.2 U101.3(STAT2) U201.20(IO16) ; also on sheet 5
FB_3V45: R111.2 R112.1 U102.4(FB)
GSR_EN: U201.11(IO7) ; also on sheet 3
ICHG_SET: C104.1 R104.1 U101.8(ISET)
ILIM_SET: R103.1 U101.7(ILIM/VSET)
IMU_HOST_RX: U201.22(IO18) ; also on sheet 4
IMU_HOST_TX: U201.21(IO17) ; also on sheet 4
LED_FAULT: U201.17(IO13) ; also on sheet 5
LED_SYS: U201.16(IO12) ; also on sheet 5
MCU_EN: C203.1 R202.2 SW202.1 SW202.2 U201.45(EN) ; also on sheet 5
MCU_USB_DM: R204.2 U201.23(IO19)
MCU_USB_DP: R205.2 U201.24(IO20)
OPT_MOTION: U201.14(IO10) ; also on sheet 4
OPT_SCL: U201.12(IO8) ; also on sheet 4
OPT_SDA: U201.13(IO9) ; also on sheet 4
PWR_EN: J104.1 R113.2 U102.1(EN)
PWR_GOOD: R115.2 U102.5(PG) U201.27(IO47)
PWR_MODE: R114.1 U102.2(MODE)
SW_L1: L101.1 U102.9(L1)
SW_L2: L101.2 U102.7(L2)
SYS: C103.1 C105.1 R106.1 R113.1 U101.1(SYS) U102.10(VIN)
TIP_SW: U201.15(IO11) ; also on sheet 4
UART0_RX: U201.40(RXD0) ; also on sheet 5
UART0_TX: U201.39(TXD0) ; also on sheet 5
USB_5V: C101.1 U101.10(IN) U104.5(QOD) U104.6(VOUT)
USB_ABSENT: U201.18(IO14) ; also on sheet 5
USB_CT: C108.1 U104.4(CT)
USB_DM: J101.A7(DN1) J101.B7(DN2) R204.1 U103.2(D-)
USB_DP: J101.A6(DP1) J101.B6(DP2) R205.1 U103.1(D+)
USB_RAW: C108.2 C109.1 F101.2 U104.1(VIN) U104.3(ON)

Not connected (* = marked no-connect by the designer): J101 A8(SBU1)* B8(SBU2)*; U201 7(IO3)* 26(IO26)* 28(IO33)* 29(IO34)* 31(IO35)* 32(IO36)* 33(IO37)* 34(IO38)* 35(IO39)* 36(IO40)* 37(IO41)* 38(IO42)* 41(IO45)* 44(IO46)*

## Notes on the sheets
sheet 1
- 01  USB-C、电池充电与 3.45 V 电源
- USB 2.0 / 两个独立 CC 下拉
- BQ25185 电源路径 / 充电参数待电池确认
- TPS63802 升降压 / 3.45 V
- USB slew: CT capacitor connects to VIN. 2.2uF input, 1nF CT; QOD tied to output.
  USB_RAW -> TPS22917 -> USB_5V; verify attach/detach current.
  TPS22918 is NOT a compatible substitute: its CT connection differs.
- 接口 ESD 器件紧贴插座；USB 差分线目标 90 ohm。
  CC 电阻仅表明 UFP，不能据此允许 500 mA。
- 首次上电条件
- L101: DFE201612E-R47M=P2；短电流环路。
  C105/106/107 为0805占位，须核对有效电容与偏压。
  AGND 与 PGND 保持连续地面，布局隔开开关节点与 AFE。
  J104 短接关机，开路运行；正式开关机械型式待确定。
- 电池: 3.7V/100mAh/4.2V/带保护，充放电最大100mA。
  充电58.8mA；BLE直连PC，连续采集目标1小时。
  先用限流台架验证，记录冷启动/接管/全负载电流波形。
  电芯脉冲电流与充电温度资料未齐，不得放行原电池使用。
- 24k: 4.2V / USB输入100mA档；5.1k: 充电58.8mA。
  默认 /CE=高；电芯规格及温度匹配后才允许充电。
  J103: 10k/3435K NTC；默认热截止约60C，须匹配电芯。
- SMARTPEN | REAR BLE V0.2D3 | 2026-10-05 | SHEET 1/5 | 电池及制造条件未闭合 / 未放行 | DNP=不装
sheet 2
- 02  ESP32-S3-MINI-1-N4R2 / BLE / Native USB
- 02  BLE V0.2 - nRF52840 / Native USB / SWD
- 主控恢复ESP32-S3；BLE为主要通信；板载PCB天线。2026-10-06 用户确认。
- 工程修改中 / 禁止投产；电池真实规格与新布局/布线/电源峰值尚待完成。
- MDBT50Q-1MV2 / Raytac / C5118826. All 61 pins checked against manufacturer pin map.
- SWD first flash is mandatory. USB DFU works only after bootloader provisioning.
  Set UICR PSELRESET to P0.18. BOOT_N=P0.19 is a software DFU button.
  J501: SWDIO / SWDCLK / RESET_N / BOOT_N / GND / VTref.
- Normal-voltage mode: VDD(28) and VDDH(30) tied together. DCCH(31) NC.
  Internal 32 MHz crystal and REG1 inductor included. Firmware enables DCDCEN.
  LF clock uses calibrated internal RC; XL1/XL2 left NC. NFC pins left NC.
- Native USB: GPIO19 D- / GPIO20 D+. Keep matched routing and series resistors near U201.
  SW201=BOOT GPIO0; hold BOOT, pulse SW202=EN RESET to enter ROM download.
  J501 uses UART0 TX/RX + EN + BOOT + GND + VTref. No SWD interface.
- USB FS: 27 ohm series close to module. Route D+/D- together.
  VBUS pin supplied from USB_5V only; never connect it to battery.
  3V45 is regulated supply, not raw 4.2 V battery.
- Antenna: all-layer copper keepout over first 3.8 mm and across PCB edge.
  Also reserve the 1.6 x 1.2 mm top copper notch from Raytac footprint guide.
  No I2C/UART assigned to radio-sensitive low-frequency-only GPIO.
- IO26 is reserved for internal PSRAM on -N4R2. GPIO3/45/46 have no external loads.
  GPIO47=PWR_GOOD, GPIO48=BAT_SENSE_EN. GPIO38/40 remain unused.
  J402 TIP_SW -> GPIO11 / module pad15; falling edge means pen down.
- BLE packets carry device timestamps and sequence numbers; PC receive time is not sample time.
  Target: optical 500 Hz, IMU 200 Hz, EDA 100 Hz. Batch notification payloads.
  Battery: 100 mAh, charge/discharge <=100 mA. Measure full-system peaks before release.
- Supply 3V45 connects module 3V3 pad3; allowed module operating range 3.0-3.6V.
  C206/C214=10uF bulk; C207=100nF; EN R202=10k + C203=1uF.
  Supply transient margin, battery continuous/peak capability and runtime must be verified.
- Module PCB antenna faces board tail. Keep antenna zone free of copper/components on all layers.
  Place battery, JY901S and metal away from antenna. No external RF connector.
- Rear_Mainboard_ESP32S3_V0.3 | REVISION IN PROGRESS | NO MANUFACTURING ORDER
